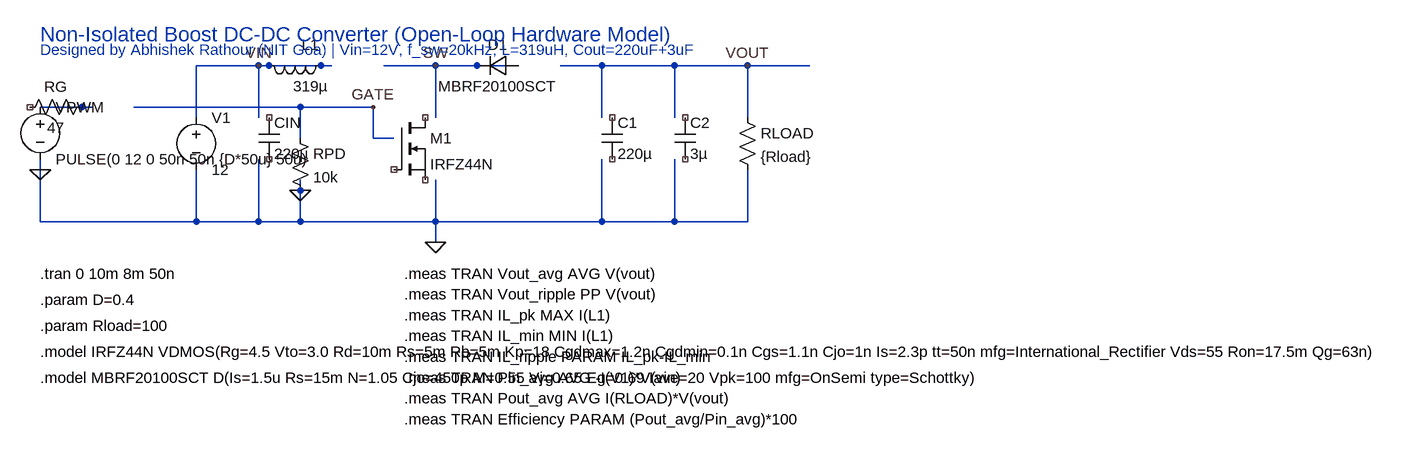
[diagram p0: schematic boost_converter_open_loop.asc]
boost_converter_open_loop.asc, the LTspice schematic file:
Version 4
SHEET 1 1200 800
WIRE 96 112 0 112
WIRE 208 112 96 112
WIRE 368 112 288 112
WIRE 496 112 368 112
WIRE 624 112 560 112
WIRE 736 112 624 112
WIRE 848 112 736 112
WIRE 944 112 848 112
WIRE 0 192 0 112
WIRE 96 192 96 112
WIRE 368 192 368 112
WIRE 624 192 624 112
WIRE 736 192 736 112
WIRE 848 192 848 112
WIRE 0 304 0 272
WIRE 96 304 96 256
WIRE 368 304 368 288
WIRE 624 304 624 256
WIRE 736 304 736 256
WIRE 848 304 848 272
WIRE 0 352 0 304
WIRE 96 352 0 352
WIRE 96 352 96 304
WIRE 368 352 96 352
WIRE 368 352 368 304
WIRE 624 352 368 352
WIRE 624 352 624 304
WIRE 736 352 624 352
WIRE 736 352 736 304
WIRE 848 352 736 352
WIRE 848 352 848 304
WIRE 368 384 368 352
WIRE -160 176 -240 176
WIRE -64 176 -96 176
WIRE 160 176 -64 176
WIRE 272 176 160 176
WIRE 304 224 272 224
WIRE 272 224 272 176
WIRE 160 224 160 176
WIRE 160 304 160 288
WIRE 160 352 160 304
WIRE 160 352 96 352
WIRE -240 272 -240 256
WIRE -240 352 -240 272
WIRE -240 352 -160 352
WIRE -160 352 0 352
FLAG 368 384 0
FLAG -240 272 0
FLAG 160 304 0
FLAG 96 112 VIN
FLAG 368 112 SW
FLAG 848 112 VOUT
FLAG 272 176 GATE
SYMBOL voltage 0 176 R0
WINDOW 123 0 0 Left 2
WINDOW 39 0 0 Left 2
SYMATTR InstName V1
SYMATTR Value 12
SYMBOL cap 96 192 R0
SYMATTR InstName CIN
SYMATTR Value 220µ
SYMATTR SpiceLine Rser=0.045
SYMBOL ind 208 96 R90
WINDOW 0 0 32 VBottom 2
WINDOW 3 32 32 VTop 2
SYMATTR InstName L1
SYMATTR Value 319µ
SYMATTR SpiceLine Rser=0.03
SYMBOL diode 496 96 R90
WINDOW 0 0 32 VBottom 2
WINDOW 3 32 32 VTop 2
SYMATTR InstName D1
SYMATTR Value MBRF20100SCT
SYMBOL nmos 304 192 R0
SYMATTR InstName M1
SYMATTR Value IRFZ44N
SYMBOL cap 624 192 R0
SYMATTR InstName C1
SYMATTR Value 220µ
SYMATTR SpiceLine Rser=0.045
SYMBOL cap 736 192 R0
SYMATTR InstName C2
SYMATTR Value 3µ
SYMATTR SpiceLine Rser=0.005
SYMBOL res 832 176 R0
SYMATTR InstName RLOAD
SYMATTR Value {Rload}
SYMBOL voltage -240 160 R0
WINDOW 123 0 0 Left 2
WINDOW 39 0 0 Left 2
SYMATTR InstName VPWM
SYMATTR Value PULSE(0 12 0 50n 50n {D*50u} 50u)
SYMBOL res -160 160 R90
WINDOW 0 0 56 VBottom 2
WINDOW 3 32 56 VTop 2
SYMATTR InstName RG
SYMATTR Value 47
SYMBOL res 144 208 R0
SYMATTR InstName RPD
SYMATTR Value 10k
TEXT -240 432 Left 2 !.tran 0 10m 8m 50n
TEXT -240 472 Left 2 !.param D=0.4
TEXT -240 512 Left 2 !.param Rload=100
TEXT -240 552 Left 2 !.model IRFZ44N VDMOS(Rg=4.5 Vto=3.0 Rd=10m Rs=5m Rb=5m Kp=18 Cgdmax=1.2n Cgdmin=0.1n Cgs=1.1n Cjo=1n Is=2.3p tt=50n mfg=International_Rectifier Vds=55 Ron=17.5m Qg=63n)
TEXT -240 592 Left 2 !.model MBRF20100SCT D(Is=1.5u Rs=15m N=1.05 Cjo=450p M=0.55 Vj=0.65 Eg=0.69 Iave=20 Vpk=100 mfg=OnSemi type=Schottky)
TEXT 320 432 Left 2 !.meas TRAN Vout_avg AVG V(vout)
TEXT 320 464 Left 2 !.meas TRAN Vout_ripple PP V(vout)
TEXT 320 496 Left 2 !.meas TRAN IL_pk MAX I(L1)
TEXT 320 528 Left 2 !.meas TRAN IL_min MIN I(L1)
TEXT 320 560 Left 2 !.meas TRAN IL_ripple PARAM IL_pk-IL_min
TEXT 320 592 Left 2 !.meas TRAN Pin_avg AVG -I(V1)*V(vin)
TEXT 320 624 Left 2 !.meas TRAN Pout_avg AVG I(RLOAD)*V(vout)
TEXT 320 656 Left 2 !.meas TRAN Efficiency PARAM (Pout_avg/Pin_avg)*100
TEXT -240 64 Left 3 ;Non-Isolated Boost DC-DC Converter (Open-Loop Hardware Model)
TEXT -240 88 Left 2 ;Designed by Abhishek Rathour (NIT Goa) | Vin=12V, f_sw=20kHz, L=319uH, Cout=220uF+3uF

The netlist it stands for:
* boost_converter_open_loop.asc
V1 VIN 0 12
CIN NC_01 NC_02 220µ Rser=0.045
L1 VIN VIN 319µ Rser=0.03
D1 SW SW MBRF20100SCT
* M1: IRFZ44N (symbol nmos not certain, pin order unknown); nets seen at it: 
C1 NC_06 NC_07 220µ Rser=0.045
C2 NC_08 NC_09 3µ Rser=0.005
RLOAD VOUT 0 {Rload}
VPWM N001 0 PULSE(0 12 0 50n 50n {D*50u} 50u)
RG N001 NC_10 47
RPD GATE 0 10k
.model D D
.lib standard.dio
.tran 0 10m 8m 50n
.param D=0.4
.param Rload=100
.model IRFZ44N VDMOS(Rg=4.5 Vto=3.0 Rd=10m Rs=5m Rb=5m Kp=18 Cgdmax=1.2n Cgdmin=0.1n Cgs=1.1n Cjo=1n Is=2.3p tt=50n mfg=International_Rectifier Vds=55 Ron=17.5m Qg=63n)
.model MBRF20100SCT D(Is=1.5u Rs=15m N=1.05 Cjo=450p M=0.55 Vj=0.65 Eg=0.69 Iave=20 Vpk=100 mfg=OnSemi type=Schottky)
.meas TRAN Vout_avg AVG V(vout)
.meas TRAN Vout_ripple PP V(vout)
.meas TRAN IL_pk MAX I(L1)
.meas TRAN IL_min MIN I(L1)
.meas TRAN IL_ripple PARAM IL_pk-IL_min
.meas TRAN Pin_avg AVG -I(V1)*V(vin)
.meas TRAN Pout_avg AVG I(RLOAD)*V(vout)
.meas TRAN Efficiency PARAM (Pout_avg/Pin_avg)*100
* Non-Isolated Boost DC-DC Converter (Open-Loop Hardware Model)
* Designed by Abhishek Rathour (NIT Goa) | Vin=12V, f_sw=20kHz, L=319uH, Cout=220uF+3uF
.backanno
.end